# Altium schematic sheet SIM.SchDoc
size A; SheetNumber: 6; SheetTotal: 6
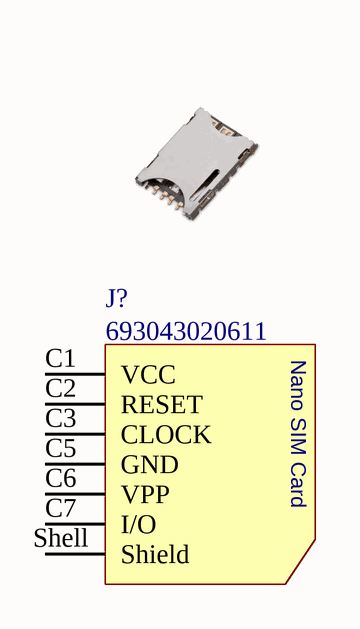
[diagram p0: SIM.SchDoc]

## Parts
J?  693043020611  [693043020611]

## Nets

Not connected (* = marked no-connect by the designer): J? C1(VCC) C2(RESET) C3(CLOCK) C5(GND) C6(VPP) C7(I/O) Shell(Shield)

## Notes on the sheet
- (in symbol CMP-1502-00157-3) Nano SIM Card

## Library data of the parts
J? = CMP-1502-00157-3: Memory Card Connectors WR-CRD Nano SIM SMT 1.2mm Push/Pull; Number of Positions: 6; Insulation Resistance: 500MΩ; Operating Supply Voltage: 15V; Current Rating: 1A; Mount: Surface Mount; Connector Type: Connector; Contact Plating: Gold; Height: 1.3mm; Number of Pins: 6; Max Operating Temperature: 85°C; Lead Free: Lead Free; Packaging: Tape and Reel; REACH SVHC: Unknown; Features: Shielded; Contact Material: Gold; RoHS: Compliant; Number of Contacts: 6; Min Operating Temperature: -25°C; Voltage Rating: 15V